# Altium project Grantiot.PrjPcb (part 1 of 4)
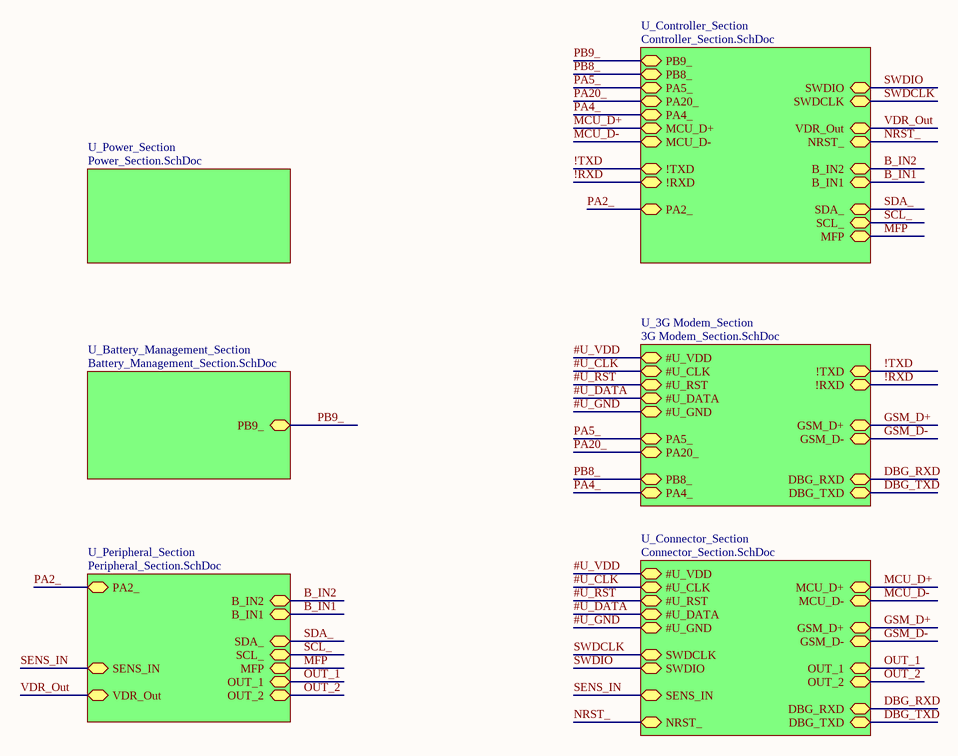
[diagram p0: Top Sheet.SchDoc]
7 sheets, 187 parts. Net scope: hierarchical (ports join the sheet entries above them; power ports are global).
Board file: Grantv3.PcbDoc
Sheets:
  Top Sheet.SchDoc
    U_Power_Section = Power_Section.SchDoc
    U_Battery_Management_Section = Battery_Management_Section.SchDoc
    U_Controller_Section = Controller_Section.SchDoc
    U_3G Modem_Section = 3G Modem_Section.SchDoc
    U_Peripheral_Section = Peripheral_Section.SchDoc
    U_Connector_Section = Connector_Section.SchDoc

## Sheet Top Sheet.SchDoc
size A4; DocumentNumber: 1; SheetNumber: 1; SheetTotal: 7

### Sub-sheets
U_3G Modem_Section = 3G Modem_Section.SchDoc: #U_CLK (bidir), #U_RST (bidir), #U_DATA (bidir), GSM_D+ (bidir), #U_GND (bidir), PA5_ (bidir), PA20_ (bidir), #U_VDD (bidir), !TXD (bidir), !RXD (bidir), PB8_ (bidir), PA4_ (bidir), DBG_TXD (bidir), DBG_RXD (bidir), GSM_D- (bidir)
U_Battery_Management_Section = Battery_Management_Section.SchDoc: PB9_ (bidir)
U_Connector_Section = Connector_Section.SchDoc: #U_VDD (bidir), GSM_D+ (bidir), MCU_D+ (bidir), #U_GND (bidir), NRST_ (bidir), #U_CLK (bidir), SWDCLK (bidir), #U_DATA (bidir), GSM_D- (bidir), #U_RST (bidir), SWDIO (bidir), SENS_IN (bidir), OUT_1 (bidir), OUT_2 (bidir), DBG_TXD (bidir), DBG_RXD (bidir), MCU_D- (bidir)
U_Controller_Section = Controller_Section.SchDoc: PA20_ (bidir), SWDIO (bidir), PA5_ (bidir), MCU_D+ (bidir), NRST_ (bidir), MCU_D- (bidir), SWDCLK (bidir), PA2_ (bidir), B_IN2 (bidir), B_IN1 (bidir), !TXD (bidir), !RXD (bidir), SDA_ (bidir), SCL_ (bidir), VDR_Out (bidir), PB8_ (bidir), PA4_ (bidir), MFP (bidir), PB9_ (bidir)
U_Peripheral_Section = Peripheral_Section.SchDoc: PA2_ (bidir), B_IN2 (bidir), B_IN1 (bidir), SCL_ (bidir), SDA_ (bidir), VDR_Out (bidir), OUT_1 (bidir), SENS_IN (bidir), OUT_2 (bidir), MFP (bidir)
U_Power_Section = Power_Section.SchDoc: no entries

### Nets
!RXD: sheet U_Controller_Section/!RXD, sheet U_3G Modem_Section/!RXD
!TXD: sheet U_Controller_Section/!TXD, sheet U_3G Modem_Section/!TXD
#U_CLK: sheet U_3G Modem_Section/#U_CLK, sheet U_Connector_Section/#U_CLK
#U_DATA: sheet U_3G Modem_Section/#U_DATA, sheet U_Connector_Section/#U_DATA
#U_GND: sheet U_3G Modem_Section/#U_GND, sheet U_Connector_Section/#U_GND
#U_RST: sheet U_3G Modem_Section/#U_RST, sheet U_Connector_Section/#U_RST
#U_VDD: sheet U_3G Modem_Section/#U_VDD, sheet U_Connector_Section/#U_VDD
B_IN1: sheet U_Controller_Section/B_IN1, sheet U_Peripheral_Section/B_IN1
B_IN2: sheet U_Controller_Section/B_IN2, sheet U_Peripheral_Section/B_IN2
DBG_RXD: sheet U_3G Modem_Section/DBG_RXD, sheet U_Connector_Section/DBG_RXD
DBG_TXD: sheet U_3G Modem_Section/DBG_TXD, sheet U_Connector_Section/DBG_TXD
GSM_D+: sheet U_3G Modem_Section/GSM_D+, sheet U_Connector_Section/GSM_D+
GSM_D-: sheet U_3G Modem_Section/GSM_D-, sheet U_Connector_Section/GSM_D-
MCU_D+: sheet U_Controller_Section/MCU_D+, sheet U_Connector_Section/MCU_D+
MCU_D-: sheet U_Controller_Section/MCU_D-, sheet U_Connector_Section/MCU_D-
MFP: sheet U_Controller_Section/MFP, sheet U_Peripheral_Section/MFP
NRST_: sheet U_Controller_Section/NRST_, sheet U_Connector_Section/NRST_
OUT_1: sheet U_Peripheral_Section/OUT_1, sheet U_Connector_Section/OUT_1
OUT_2: sheet U_Peripheral_Section/OUT_2, sheet U_Connector_Section/OUT_2
PA2_: sheet U_Controller_Section/PA2_, sheet U_Peripheral_Section/PA2_
PA4_: sheet U_Controller_Section/PA4_, sheet U_3G Modem_Section/PA4_
PA5_: sheet U_Controller_Section/PA5_, sheet U_3G Modem_Section/PA5_
PA20_: sheet U_Controller_Section/PA20_, sheet U_3G Modem_Section/PA20_
PB8_: sheet U_Controller_Section/PB8_, sheet U_3G Modem_Section/PB8_
PB9_: sheet U_Battery_Management_Section/PB9_, sheet U_Controller_Section/PB9_
SCL_: sheet U_Controller_Section/SCL_, sheet U_Peripheral_Section/SCL_
SDA_: sheet U_Controller_Section/SDA_, sheet U_Peripheral_Section/SDA_
SENS_IN: sheet U_Peripheral_Section/SENS_IN, sheet U_Connector_Section/SENS_IN
SWDCLK: sheet U_Controller_Section/SWDCLK, sheet U_Connector_Section/SWDCLK
SWDIO: sheet U_Controller_Section/SWDIO, sheet U_Connector_Section/SWDIO
VDR_Out: sheet U_Controller_Section/VDR_Out, sheet U_Peripheral_Section/VDR_Out

## Sheet Power_Section.SchDoc
size A4; DocumentNumber: 2; SheetNumber: 2; SheetTotal: 7
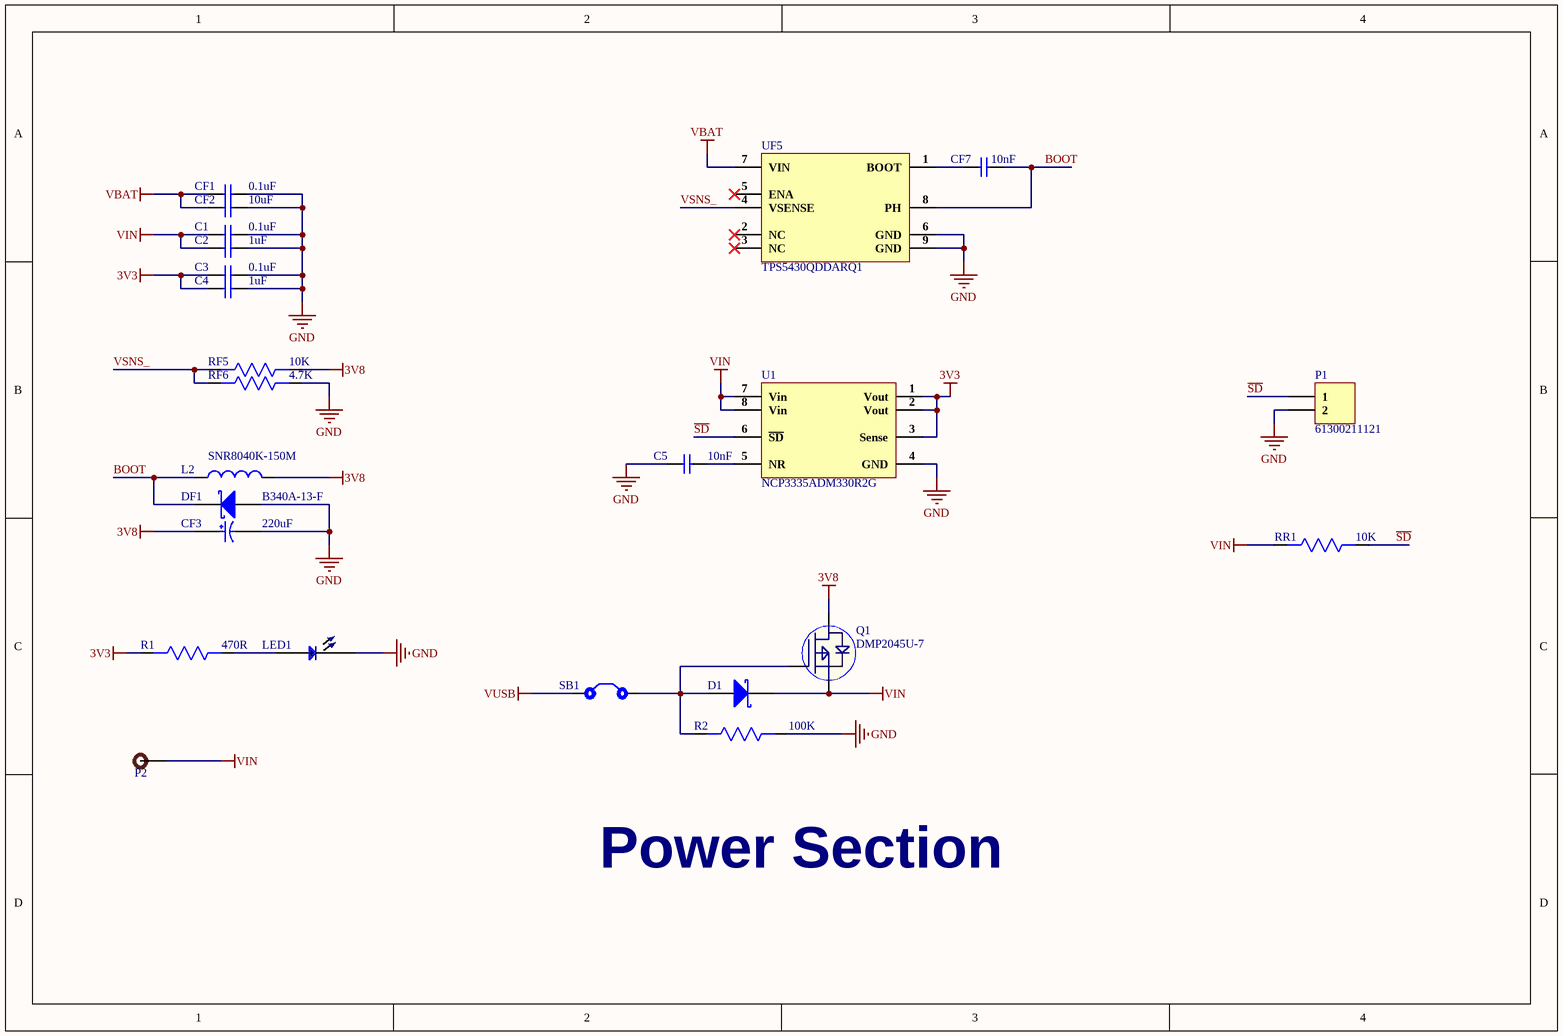
[diagram p1: Power_Section.SchDoc]

### Parts
C1  0.1uF  [Cap0402]
C2  1uF  [Cap0402]
C3  0.1uF  [Cap0402]
C4  1uF  [Cap0402]
C5  10nF  [Cap0402]
CF1  0.1uF  [Cap0402]
CF2  10uF  [Cap0603]
CF3  220uF
CF7  10nF  [Cap0402]
D1  PMEG3010ER,115  [SOD123W]  (value not drawn)
DF1  B340A-13-F  [B340A-13-F]
L2  SNR8040K-150M  [SNR8040K-150M]
LED1  TJ-S1005SW4TGLC2R-A5  [LED 0402]  (value not drawn)
P1  61300211121  [HDR1X2]
P2  TEST POINT  [TEST POINT]  (value not drawn)
Q1  DMP2045U-7  [SOT23-3]
R1  470R  [Res0402]
R2  100K  [Res0402]
RF5  10K  [Res0402]
RF6  4.7K  [Res0402]
RR1  10K  [Res0402]
SB1  Solder Bridge  [Solder Bridge]  (value not drawn)
U1  NCP3335ADM330R2G  [NCP3335ADM330R2G]
UF5  TPS5430QDDARQ1  [TPS5430QDDARQ1]

### Nets
3V3: C3.1 C4.1 R1.2 U1.1(Vout) U1.2(Vout) U1.3(Sense)
3V8: CF3.1 L2.2 Q1.3(D) RF5.1
GND: C1.2 C2.2 C3.2 C4.2 C5.1 CF1.2 CF2.2 CF3.2 DF1.2(A) LED1.2 P1.2 R2.1 RF6.1 U1.4(GND) UF5.6(GND) UF5.9(GND)
VBAT: CF1.1 CF2.1 UF5.7(VIN)
VIN: C1.1 C2.1 D1.K P2.1 Q1.2(S) RR1.2 U1.7(Vin) U1.8(Vin)
VUSB: SB1.1
~{SD}: P1.1 RR1.1 U1.6(~{SD})
BOOT: CF7.2 DF1.1(K) L2.1 UF5.8(PH)
VSNS_: RF5.2 RF6.2 UF5.4(VSENSE)
NetC5_2: C5.2 U1.5(NR)
NetCF7_1: CF7.1 UF5.1(BOOT)
NetD1_A: D1.A Q1.1(G) R2.2 SB1.2
NetLED1_1: LED1.1 R1.1

Not connected (* = marked no-connect by the designer): UF5 2(NC)* 3(NC)* 5(ENA)*

### Notes on the sheet
- Power Section

### Library data of the parts
C1 C3 CF1 = CC0402KRX7R7BB104: CAP CER 0.1UF 16V X7R 0402; Manufacturer: Yageo; Tolerance: 10%; Capacitance: 100nF; Supplier 1: Digi-Key; Manufacturer Part Number: CC0402KRX7R7BB104; Stock 1: 16982736; Pricing 1: 1=0.1, 10=0.034, 100=0.015, 500=0.0107, 1000=0.00841, 2500=0.00764, 5000=0.00703 (USD); Mount: Surface Mount; Case/Package: 0402; Number of Pins: 2; Case Code (Metric): 1005; Case Code (Imperial): 0402; Min Operating Temperature: -55°C; Max Operating Temperature: 125°C; Dielectric: X7R; Voltage Rating: 16V; Voltage Rating (DC): 16V; Packaging: Tape and Reel; Package Quantity: 1; Termination: SMD/SMT; Composition: Ceramic; Voltage: 16V; Length: 1mm; Height: 0.5mm; Width: 0.02inch; Thickness: 0.022inch; Depth: 0.5mm; Radiation Hardening: No; REACH SVHC: No SVHC; Lead Free: Lead Free; Halogen Free: Halogen Free; ComponentLink1URL: http://www.yageo.com/documents/recent/UPY-GPHC_X7R_6.3V-to-50V_8.pdf?src-supplier=Avnet+Europe; ComponentLink1Description: http://www.yageo.com/documents/recent/UPY-GPHC_X7R_6.3V-to-50V_8.pdf?src-supplier=Avnet+Europe; ComponentLink2URL: http://www.yageo.com/documents/recent/UPY-GPHC_X7R_6.3V-to-50V_18.pdf?src-supplier=Digi-Key; ComponentLink2Description: http://www.yageo.com/documents/recent/UPY-GPHC_X7R_6.3V-to-50V_18.pdf?src-supplier=Digi-Key; ComponentLink3URL: http://www.yageo.com/documents/recent/UPY-GPHC_X7R_6.3V-to-50V_8.pdf?src-supplier=Avnet; ComponentLink3Description: http://www.yageo.com/documents/recent/UPY-GPHC_X7R_6.3V-to-50V_8.pdf?src-supplier=Avnet; ComponentLink4URL: http://www.yageo.com/documents/recent/UPY-GPHC_X7R_6.3V-to-50V_18.pdf?src-supplier=Mouser; ComponentLink4Description: http://www.yageo.com/documents/recent/UPY-GPHC_X7R_6.3V-to-50V_18.pdf?src-supplier=Mouser; ComponentLink5URL: http://www.farnell.com/datasheets/2167236.pdf?src-supplier=Element14; ComponentLink5Description: http://www.farnell.com/datasheets/2167236.pdf?src-supplier=Element14; ComponentLink6URL: http://www.farnell.com/datasheets/1489800.pdf?src-supplier=Element14; ComponentLink6Description: http://www.farnell.com/datasheets/1489800.pdf?src-supplier=Element14; Supplier Part Number 1: 311-1338-1-ND
C2 C4 = GRM155R61E105KA12D: CAP CER 1UF 25V X5R 0402; Manufacturer: Murata; Material: Ceramic; Tolerance: 10%; Supplier 1: Digi-Key; Manufacturer Part Number: GRM155R61E105KA12D; Stock 1: 1194305; Pricing 1: 1=0.11, 10=0.077, 100=0.0363, 500=0.02546, 1000=0.02108, 2500=0.01962, 5000=0.01795 (USD); Mount: Surface Mount; Case/Package: 0402; Weight: 0.000212oz; Case Code (Metric): 1005; Case Code (Imperial): 0402; Min Operating Temperature: -55°C; Max Operating Temperature: 85°C; Capacitance: 1uF; Voltage Rating: 25V; Packaging: Tape and Reel; Dielectric: X5R; Voltage: 25V; Termination: SMD/SMT; Voltage Rating (DC): 25V; Package Quantity: 10000; Length: 1mm; Height: 0.5mm; Width: 0.5mm; Thickness: 0.022inch; Depth: 0.5mm; REACH SVHC: No SVHC; Lead Free: Lead Free; ComponentLink1URL: http://www.farnell.com/datasheets/2048341.pdf?src-supplier=Element14; ComponentLink1Description: http://www.farnell.com/datasheets/2048341.pdf?src-supplier=Element14; Supplier Part Number 1: 490-10017-1-ND
C5 CF7 = CC0402KRX7R8BB103: CAP CER 10000PF 25V X7R 0402; Manufacturer: Yageo; Tolerance: 10%; Supplier 1: Digi-Key; Manufacturer Part Number: CC0402KRX7R8BB103; Stock 1: 0; Pricing 1: 1=0.1, 10=0.021, 100=0.0093, 500=0.00666, 1000=0.00523, 2500=0.00476, 5000=0.00438 (USD); Mount: Surface Mount; Case/Package: 0402; Case Code (Metric): 1005; Case Code (Imperial): 0402; Min Operating Temperature: -55°C; Max Operating Temperature: 125°C; Capacitance: 10nF; Dielectric: X7R; Voltage Rating: 25V; Package Quantity: 1; Packaging: Tape and Reel; Voltage Rating (DC): 25V; Termination: SMD/SMT; Composition: Ceramic; Length: 1mm; Height: 0.5mm; Depth: 0.5mm; Width: 0.02inch; Thickness: 0.022inch; Radiation Hardening: No; REACH SVHC: Unknown; Lead Free: Lead Free; Halogen Free: Halogen Free; ComponentLink1URL: http://www.yageo.com/documents/recent/UPY-GPHC_X7R_6.3V-to-50V_18.pdf?src-supplier=Digi-Key; ComponentLink1Description: http://www.yageo.com/documents/recent/UPY-GPHC_X7R_6.3V-to-50V_18.pdf?src-supplier=Digi-Key; ComponentLink2URL: https://www.verical.com/server-webapp/html/getDatasheet?partID=375418&src-supplier=Verical; ComponentLink2Description: https://www.verical.com/server-webapp/html/getDatasheet?partID=375418&src-supplier=Verical; ComponentLink3URL: http://www.yageo.com/documents/recent/UPY-GPHC_X7R_6.3V-to-50V_8.pdf?src-supplier=Avnet; ComponentLink3Description: http://www.yageo.com/documents/recent/UPY-GPHC_X7R_6.3V-to-50V_8.pdf?src-supplier=Avnet; ComponentLink4URL: https://4donline.ihs.com/images/VipMasterIC/IC/YAGO/YAGO-S-A0003557223/YAGO-S-A0003557223-1.pdf?hkey=52A5661711E402568146F3353EA87419&src-supplier=Element14; ComponentLink4Description: https://4donline.ihs.com/images/VipMasterIC/IC/YAGO/YAGO-S-A0003557223/YAGO-S-A0003557223-1.pdf?hkey=52A5661711E402568146F3353EA87419&src-supplier=Element14; ComponentLink5URL: http://www.farnell.com/datasheets/2167236.pdf?src-supplier=Element14; ComponentLink5Description: http://www.farnell.com/datasheets/2167236.pdf?src-supplier=Element14; ComponentLink6URL: http://www.mouser.com/ds/2/447/Yageo_UPY-GP_NP0_16V-to-50V_9-358835.pdf?src-supplier=Mouser; ComponentLink6Description: http://www.mouser.com/ds/2/447/Yageo_UPY-GP_NP0_16V-to-50V_9-358835.pdf?src-supplier=Mouser; Supplier Part Number 1: 311-1337-1-ND
CF2 = EMK107BBJ106MA-T: CAP CER 10UF 16V X5R 0603; Manufacturer: Taiyo Yuden; Tolerance: 20%; Supplier 1: Digi-Key; Manufacturer Part Number: EMK107BBJ106MA-T; Stock 1: 495661; Pricing 1: 1=0.39, 10=0.269, 100=0.1617, 500=0.12126, 1000=0.10239 (USD); Mount: Surface Mount; Case/Package: 0603; Case Code (Metric): 1608; Case Code (Imperial): 0603; Min Operating Temperature: -55°C; Max Operating Temperature: 85°C; Capacitance: 10uF; Dielectric: X5R; Packaging: Tape and Reel; Voltage Rating: 16V; Package Quantity: 1; Termination: SMD/SMT; Voltage Rating (DC): 16V; Length: 0.063inch; Height: 0.8mm; Width: 0.031inch; Thickness: 0.031inch; REACH SVHC: Unknown; Halogen Free: Halogen Free; ComponentLink1URL: https://media.digikey.com/pdf/Data%20Sheets/Taiyo%20Yuden%20PDFs%20URL%20links/EMK107BBJ106MA-T.pdf?src-supplier=Digi-Key; ComponentLink1Description: https://media.digikey.com/pdf/Data%20Sheets/Taiyo%20Yuden%20PDFs%20URL%20links/EMK107BBJ106MA-T.pdf?src-supplier=Digi-Key; ComponentLink2URL: http://www.onlinecomponents.com/productFiles/mf-TAI/3emk107bbj106ma-t.pdf?src-supplier=Onlinecomponents.com; ComponentLink2Description: http://www.onlinecomponents.com/productFiles/mf-TAI/3emk107bbj106ma-t.pdf?src-supplier=Onlinecomponents.com; ComponentLink3URL: http://www.mouser.com/ds/2/396/mlcc11_hq_e-541564.pdf?src-supplier=Mouser; ComponentLink3Description: http://www.mouser.com/ds/2/396/mlcc11_hq_e-541564.pdf?src-supplier=Mouser; Supplier Part Number 1: 587-3238-1-ND
CF3 = T491X227M016AT: CAP TANT 220UF 20% 16V 2917; Manufacturer: KEMET; Dielectric Material: Tantalum; ESR (Equivalent Series Resistance): 500mR; Polarity: Polar; Dissipation Factor: 10%; Leakage Current: 35.2uA; Ripple Current: 574mA; Life (Hours): 2000Hour; Supplier 1: Digi-Key; Manufacturer Part Number: T491X227M016AT; Stock 1: 16347; Pricing 1: 1=2.53, 10=2.045, 100=1.5613 (USD); Mount: Surface Mount; Case/Package: 2917; Number of Pins: 2; Case Code (Metric): 7343; Case Code (Imperial): 2917; Min Operating Temperature: -55°C; Max Operating Temperature: 125°C; Capacitance: 220uF; Tolerance: 20%; Packaging: Tape and Reel; Voltage Rating: 16V; Package Quantity: 1; Termination: SMD/SMT; Voltage Rating (DC): 16V; Features: General Purpose; Length: 7.3mm; Height: 4.3mm; Depth: 4.3mm; Width: 0.169inch; Height - Seated (Max): 0.169inch; Radiation Hardening: No; REACH SVHC: No SVHC; Lead Free: Lead Free; ComponentLink1URL: https://search.kemet.com/component-edge/download/datasheet/T491X227M016AT.pdf?src-supplier=Digi-Key; ComponentLink1Description: https://search.kemet.com/component-edge/download/datasheet/T491X227M016AT.pdf?src-supplier=Digi-Key; ComponentLink2URL: http://www.mouser.com/ds/2/212/KEM_T2005_T491-1093550.pdf?src-supplier=Mouser; ComponentLink2Description: http://www.mouser.com/ds/2/212/KEM_T2005_T491-1093550.pdf?src-supplier=Mouser; Supplier Part Number 1: 399-10210-1-ND
D1 = PMEG3010ER,115: DIODE SCHOTTKY 30V 1A SOD123W; Manufacturer: Nexperia; Supplier 1: Digi-Key; Manufacturer Part Number: PMEG3010ER,115; Stock 1: 75070; Pricing 1: 1=0.36, 10=0.29, 100=0.1669, 500=0.1545, 1000=0.10506 (USD); Supplier Part Number 1: 1727-5201-1-ND
DF1 = B340A-13-F: DIODE SCHOTTKY 40V 3A SMA; Manufacturer: Diodes; Element Configuration: Single; Peak Reverse Current: 500uA; Forward Voltage: 500mV; Max Forward Surge Current (Ifsm): 80A; Polarity: Standard; Capacitance: 250pF; Supplier 1: Digi-Key; Manufacturer Part Number: B340A-13-F; Stock 1: 369635; Pricing 1: 1=0.41, 10=0.332, 25=0.304, 100=0.1909, 250=0.18876, 500=0.17676, 1000=0.12019, 2500=0.11524 (USD); Mount: Surface Mount; Case/Package: SMA; Number of Pins: 2; Weight: 0.002258oz; Contact Plating: Tin,Matte; Min Operating Temperature: -55°C; Max Operating Temperature: 125°C; Forward Current: 3A; Max Repetitive Reverse Voltage (Vrrm): 40V; Packaging: Tape and Reel; Peak Non-Repetitive Surge Current: 80A; Package Quantity: 5000; Average Rectified Current: 3A; Termination: SMD/SMT; Voltage Rating (DC): 40V; Current Rating: 3A; Output Current: 3A; Current: 3A; Voltage: 40V; Max Reverse Voltage (DC): 40V; Length: 4.6mm; Height: 2.3mm; Width: 2.92mm; Radiation Hardening: No; REACH SVHC: No SVHC; Lead Free: Lead Free; ComponentLink1URL: http://components.arrow.com/part/dataview/41507737S9851045N2867?src-supplier=Arrow; ComponentLink1Description: http://components.arrow.com/part/dataview/41507737S9851045N2867?src-supplier=Arrow; ComponentLink2URL: http://www.farnell.com/datasheets/2238474.pdf?src-supplier=Element14; ComponentLink2Description: http://www.farnell.com/datasheets/2238474.pdf?src-supplier=Element14; ComponentLink3URL: http://www.farnell.com/datasheets/2238474.pdf?src-supplier=Newark; ComponentLink3Description: http://www.farnell.com/datasheets/2238474.pdf?src-supplier=Newark; ComponentLink4URL: https://www.diodes.com/assets/Datasheets/ds30891.pdf?src-supplier=Digi-Key; ComponentLink4Description: https://www.diodes.com/assets/Datasheets/ds30891.pdf?src-supplier=Digi-Key; ComponentLink5URL: https://www.verical.com/server-webapp/html/getDatasheet?partID=143394&src-supplier=Verical; ComponentLink5Description: https://www.verical.com/server-webapp/html/getDatasheet?partID=143394&src-supplier=Verical; Supplier Part Number 1: B340A-FDICT-ND
L2 = SNR8040K-150M: 15uH ±20% 2.5A 56mΩ SMD,8.0x8.0mm Inductors (SMD) RoHS; Manufacturer: 3L COILS; Manufacturer Part No: SNR8040K-150M; Package: Custom; Value: 15uH
LED1 = TJ-S1005SW4TGLC2R-A5: Red 625nm 0402 Light Emitting Diodes (LED) RoHS; Manufacturer: TOGIALED; Value: Custom; Manufacturer Part No: TJ-S1005SW4TGLC2R-A5; Package: 0402
P1 = Header 1x2: CONN HEADER VERT 2POS 2.54MM; Manufacturer: Wurth Electronics; Current Rating: 3A; Voltage Rating: 250V; Number of Positions: 2; Gender: Male; Connector Type: Male Pin; Pitch: 0.1inch; Supplier 1: Digi-Key; Manufacturer Part Number: 61300211121; Stock 1: 219205; Pricing 1: 1=0.13, 10=0.106, 25=0.088, 50=0.074, 100=0.067, 1000=0.061 (USD); Mount: Through Hole; Contact Plating: Gold; Housing Material: PBT; Contact Material: Copper Alloy,Copper; Color: Black; Min Operating Temperature: -40°C; Max Operating Temperature: 125°C; Number of Rows: 1; Contact Gender: Male; Packaging: Bulk; Termination: Through Hole; Number of Contacts: 2; Contact Mating Length: 0.236inch; REACH SVHC: Unknown; Lead Free: Lead Free; ComponentLink1URL: http://www.mouser.com/ds/2/445/6130xx11121-538006.pdf?src-supplier=Mouser; ComponentLink1Description: http://www.mouser.com/ds/2/445/6130xx11121-538006.pdf?src-supplier=Mouser; Supplier Part Number 1: 732-5315-ND
P2 = TEST POINT: Test Point ON
Q1 = DMP2045U-7: MOSFET P-CHAN 24V SOT23; Manufacturer: Diodes; Drain to Source Voltage (Vdss): 20V; Continuous Drain Current (ID): 4.3A; Rds On Max: 45mR; Input Capacitance: 634pF; Max Power Dissipation: 800mW; Supplier 1: Digi-Key; Manufacturer Part Number: DMP2045U-7; Stock 1: 21481; Pricing 1: 1=0.43, 10=0.323, 25=0.2828, 100=0.1535, 250=0.15272, 500=0.12524, 1000=0.09292 (USD); Mount: Surface Mount; Case/Package: SOT-23; Min Operating Temperature: -55°C; Max Operating Temperature: 150°C; Packaging: Tape and Reel; ComponentLink1URL: https://www.diodes.com/assets/Datasheets/DMP2045U.pdf?src-supplier=Digi-Key; ComponentLink1Description: https://www.diodes.com/assets/Datasheets/DMP2045U.pdf?src-supplier=Digi-Key; Supplier Part Number 1: DMP2045U-7DICT-ND
R1 = RTT02471JTH: 470 ±5% 1/16W ±100ppm/°C 0402 Chip Resistor - Surface Mount RoHS; Manufacturer: RALEC; Manufacturer Part No: RTT02471JTH; Package: 0402; Value: 470R
R2 = ERJPA2F1003X: RES SMD 100K OHM 1% 1/5W 0402; Manufacturer: Panasonic; Manufacturer Part Number: ERJ-PA2F1003X; Resistance: 100kR; Power Rating: 200mW; Voltage Rating: 50V; Temperature Coefficient: 100ppm/°C; Supplier 1: Digi-Key; Stock 1: 8829; Pricing 1: 1=0.21, 10=0.175, 100=0.0686, 1000=0.02871, 2500=0.02632, 5000=0.02393 (USD); Case/Package: 0402; Case Code (Metric): 1005; Case Code (Imperial): 0402; Min Operating Temperature: -55°C; Max Operating Temperature: 155°C; Packaging: Cut Tape; Composition: Thick Film; Number of Terminations: 2; Tolerance: 1%; Max Power Dissipation: 200mW; Voltage Rating (DC): 50V; Features: Automotive AEC-Q200; Length: 0.039inch; Height: 0.016inch; Width: 0.02inch; REACH SVHC: Unknown; ComponentLink1URL: http://www.farnell.com/datasheets/2051174.pdf?src-supplier=Element14; ComponentLink1Description: http://www.farnell.com/datasheets/2051174.pdf?src-supplier=Element14; ComponentLink2URL: https://industrial.panasonic.com/ww/system/files/data/download/catalog/id_fixed-resistors_e_1.pdf?src-supplier=Digi-Key; ComponentLink2Description: https://industrial.panasonic.com/ww/system/files/data/download/catalog/id_fixed-resistors_e_1.pdf?src-supplier=Digi-Key; Supplier Part Number 1: P17236CT-ND
RF5 RR1 = RK73B1ETTP103J: RES 10K OHM 5% 1/10W 0402; Manufacturer: KOA Speer; Resistance: 10kR; Power Rating: 63mW; Voltage Rating: 50V; Temperature Coefficient: 200ppm/°C; Supplier 1: Digi-Key; Manufacturer Part Number: RK73B1ETTP103J; Stock 1: 2917894; Pricing 1: 1=0.1, 10=0.016, 100=0.0065, 1000=0.00292, 2500=0.00253, 5000=0.00209 (USD); Mount: Surface Mount; Case/Package: 0402; Case Code (Imperial): 0402; Case Code (Metric): 1005; Min Operating Temperature: -55°C; Max Operating Temperature: 155°C; Packaging: Tape and Reel; Tolerance: 5%; Package Quantity: 10000; Composition: Thick Film; Termination: SMD/SMT; Military Standard: Not; Voltage Rating (DC): 50V; Length: 1mm; Height: 0.35mm; Width: 0.5mm; Depth: 0.5mm; Lead Free: Lead Free; ComponentLink1URL: https://www.verical.com/server-webapp/html/getDatasheet?partID=89073&src-supplier=Verical; ComponentLink1Description: https://www.verical.com/server-webapp/html/getDatasheet?partID=89073&src-supplier=Verical; Supplier Part Number 1: 2019-RK73B1ETTP103JCT-ND
RF6 = CR0402JF0472G: 4.7K ±5% 1/16W ±200ppm/°C 0402 Chip Resistor - Surface Mount RoHS; Manufacturer: LIZ Elec; Manufacturer Part No: CR0402JF0472G; Package: 0402; Value: 4.7K
SB1 = Solder Bridge: Solder Bridge ON
U1 = NCP3335ADM330R2G: IC REG LINEAR 3.3V 500MA MICRO8; Manufacturer: ON Semiconductor; Min Input Voltage: 2.6V; Max Input Voltage: 16V; Number of Outputs: 1; Max Output Current: 800mA; Polarity: Positive; Accuracy: 0.9%; Output Type: Fixed; Dropout Voltage: 340mV; Reference Voltage: 1.269V; Supplier 1: Digi-Key; Manufacturer Part Number: NCP3335ADM330R2G; Stock 1: 2299; Pricing 1: 1=1.12, 10=1.003, 25=0.952, 100=0.731, 250=0.646, 500=0.612, 1000=0.476 (USD); Mount: Surface Mount; Case/Package: MSOP; Number of Pins: 8; Min Operating Temperature: -40°C; Max Operating Temperature: 150°C; Output Voltage: 3.3V; Package Quantity: 4000; Output Current: 800mA; Packaging: Tape and Reel; Number of Regulators: 1; Min Output Voltage: 3.3V; Output Voltage Accuracy: 0.9%; Length: 3.1mm; Height: 0.95mm; Width: 3.1mm; Radiation Hardening: No; Lead Free: Lead Free; Halogen Free: Halogen Free; ComponentLink1URL: http://www.onsemi.com/pub_link/Collateral/NCP3335A-D.PDF?src-supplier=Future+Electronics; ComponentLink1Description: http://www.onsemi.com/pub_link/Collateral/NCP3335A-D.PDF?src-supplier=Future+Electronics; ComponentLink2URL: http://www.onsemi.com/pub/Collateral/NCP3335A-D.PDF?src-supplier=Digi-Key; ComponentLink2Description: http://www.onsemi.com/pub/Collateral/NCP3335A-D.PDF?src-supplier=Digi-Key; Supplier Part Number 1: NCP3335ADM330R2GOSCT-ND
UF5 = TPS5430QDDARQ1: IC REG BUCK ADJUSTABLE 3A 8SOPWR; Manufacturer: Texas Instruments; Efficiency: 95%; Number of Outputs: 1; Output Voltage: 31V; Min Input Voltage: 5.5V; Max Input Voltage: 36V; Switching Frequency: 500kHz; Synchronous Rectifier: No; Min Output Voltage: 1.22V; Quiescent Current: 3mA; Supplier 1: Digi-Key; Manufacturer Part Number: TPS5430QDDARQ1; Stock 1: 2547; Pricing 1: 1=4.81, 10=4.32, 25=4.0836, 100=3.3578, 250=3.01292, 500=2.904, 1000=2.41395 (USD); Mount: Surface Mount; Number of Pins: 8; Weight: 0.00249oz; Min Operating Temperature: -40°C; Max Operating Temperature: 125°C; Output Current: 3A; Packaging: Tape and Reel; Max Output Current: 3A; Package Quantity: 2500; Max Output Voltage: 31V; Operating Supply Voltage: 36V; Output Type: Adjustable; Radiation Hardening: No; REACH SVHC: No SVHC; Lead Free: Lead Free; ComponentLink1URL: http://www.ti.com/general/docs/lit/getliterature.tsp?genericPartNumber=TPS5430-Q1&&fileType=pdf&src-supplier=Avnet; ComponentLink1Description: http://www.ti.com/general/docs/lit/getliterature.tsp?genericPartNumber=TPS5430-Q1&&fileType=pdf&src-supplier=Avnet; ComponentLink2URL: http://focus.ti.com/lit/ds/symlink/tps5430-q1.pdf?src-supplier=Avnet+Europe; ComponentLink2Description: http://focus.ti.com/lit/ds/symlink/tps5430-q1.pdf?src-supplier=Avnet+Europe; ComponentLink3URL: http://www.ti.com/lit/ds/symlink/tps5430-q1.pdf?src-supplier=Digi-Key; ComponentLink3Description: http://www.ti.com/lit/ds/symlink/tps5430-q1.pdf?src-supplier=Digi-Key; ComponentLink4URL: http://www.farnell.com/datasheets/2019094.pdf?src-supplier=Element14; ComponentLink4Description: http://www.farnell.com/datasheets/2019094.pdf?src-supplier=Element14; ComponentLink5URL: http://www.ti.com/lit/gpn/tps5430-q1?src-supplier=Mouser; ComponentLink5Description: http://www.ti.com/lit/gpn/tps5430-q1?src-supplier=Mouser; ComponentLink6URL: http://datasheet.iiic.cc/texas_instruments/TPS5430QDDARQ1.pdf?src-supplier=IIIC; ComponentLink6Description: http://datasheet.iiic.cc/texas_instruments/TPS5430QDDARQ1.pdf?src-supplier=IIIC; Supplier Part Number 1: 296-23177-1-ND